# Altium project MOSFET_Four_nodes_network.PrjPcb (part 2 of 2)

## Sheet Sheet5.SchDoc
size A; SheetNumber: 6; SheetTotal: 10
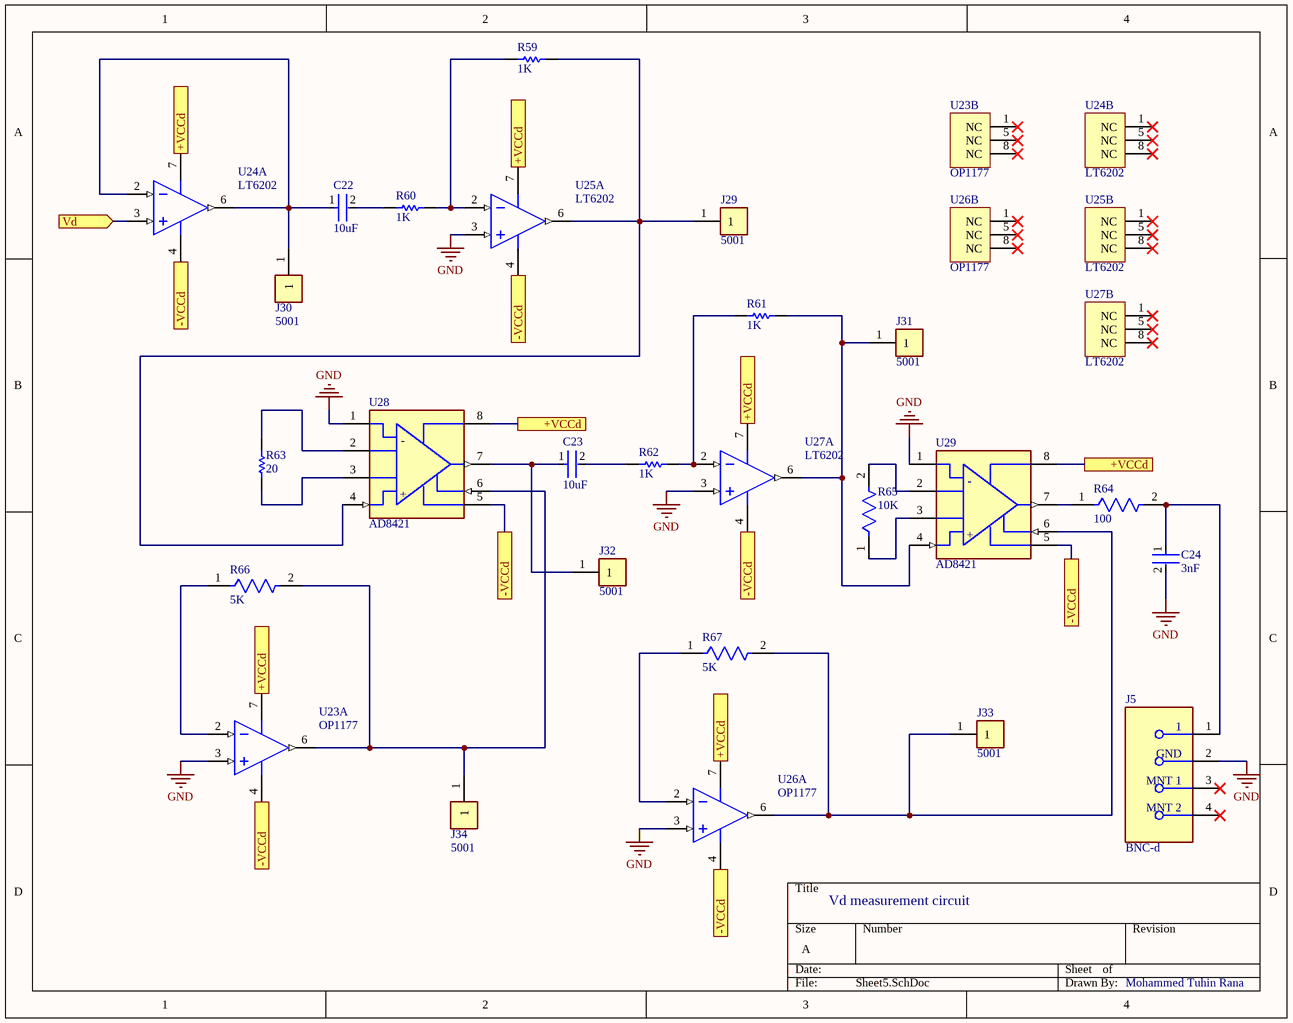
[diagram p5: Sheet5.SchDoc]

### Parts
C22  10uF  [FP-GRM21B-0_1-IPC_C]
C23  10uF  [FP-GRM21B-0_1-IPC_C]
C24  3nF  [FP-C1206C-EB-MFG]
J5  BNC-d  [FP-5413194-2-MFG]
J29  5001  [FP-5001-MFG]
J30  5001  [FP-5001-MFG]
J31  5001  [FP-5001-MFG]
J32  5001  [FP-5001-MFG]
J33  5001  [FP-5001-MFG]
J34  5001  [FP-5001-MFG]
R59  1K  [RESC3216X70X50ML20T25]
R60  1K  [RESC3216X70X50ML20T25]
R61  1K  [RESC3216X70X50ML20T25]
R62  1K  [RESC3216X70X50ML20T25]
R63  20  [RESC3216X60X45ML10T20]
R64  100  [FP-ERA3A-IPC_B]
R65  10K  [FP-ERJPA3-IPC_A]
R66  5K  [FP-RT1206-0_65-MFG]
R67  5K  [FP-RT1206-0_65-MFG]
U23  OP1177  [ADI-R-8_N]  (parts A,B of 2)
U24  LT6202  [LT-S8-8_N]  (parts A,B of 2)
U25  LT6202  [LT-S8-8_N]  (parts A,B of 2)
U26  OP1177  [ADI-R-8_N]  (parts A,B of 2)
U27  LT6202  [LT-S8-8_N]  (parts A,B of 2)
U28  AD8421  [FP-R-8-IPC_C]
U29  AD8421  [FP-R-8-IPC_C]

### Ports
+VCCd (see Sheet5[1A], Sheet5[1C], Sheet5[2A], Sheet5[2B], Sheet5[3B], Sheet5[3C], Sheet10[4B]), +VCCd (see Sheet5[1A], Sheet5[1C], Sheet5[2A], Sheet5[2B], Sheet5[3B], Sheet5[4B], Sheet10[4B]), +VCCd (see Sheet5[1A], Sheet5[1C], Sheet5[2A], Sheet5[2B], Sheet5[3C], Sheet5[4B], Sheet10[4B]), +VCCd (see Sheet5[1A], Sheet5[1C], Sheet5[2A], Sheet5[3B], Sheet5[3C], Sheet5[4B], Sheet10[4B]), +VCCd (see Sheet5[1A], Sheet5[1C], Sheet5[2B], Sheet5[3B], Sheet5[3C], Sheet5[4B], Sheet10[4B]), +VCCd (see Sheet5[1A], Sheet5[2A], Sheet5[2B], Sheet5[3B], Sheet5[3C], Sheet5[4B], Sheet10[4B]), +VCCd (see Sheet5[1C], Sheet5[2A], Sheet5[2B], Sheet5[3B], Sheet5[3C], Sheet5[4B], Sheet10[4B]), -VCCd (see Sheet5[1B], Sheet5[1D], Sheet5[2B], Sheet5[2C], Sheet5[3C], Sheet5[3D], Sheet10[3B]), -VCCd (see Sheet5[1B], Sheet5[1D], Sheet5[2B], Sheet5[2C], Sheet5[3C], Sheet5[4C], Sheet10[3B]), -VCCd (see Sheet5[1B], Sheet5[1D], Sheet5[2B], Sheet5[2C], Sheet5[3D], Sheet5[4C], Sheet10[3B]), -VCCd (see Sheet5[1B], Sheet5[1D], Sheet5[2B], Sheet5[3C], Sheet5[3D], Sheet5[4C], Sheet10[3B]), -VCCd (see Sheet5[1B], Sheet5[1D], Sheet5[2C], Sheet5[3C], Sheet5[3D], Sheet5[4C], Sheet10[3B]), -VCCd (see Sheet5[1B], Sheet5[2B], Sheet5[2C], Sheet5[3C], Sheet5[3D], Sheet5[4C], Sheet10[3B]), -VCCd (see Sheet5[1D], Sheet5[2B], Sheet5[2C], Sheet5[3C], Sheet5[3D], Sheet5[4C], Sheet10[3B]), Vd (in, see Sheet2[4B])

### Nets
GND: C24.2 J5.2(GND) U23.3(+IN) U25.3(+IN) U26.3(+IN) U27.3(+IN) U28.1(-IN) U29.1(-IN)
NetC22_1: C22.1 J30.1 U24.2(-IN) U24.6(OUT)
NetC22_2: C22.2 R60.1
NetC23_1: C23.1 J32.1 U28.7(VOUT)
NetC23_2: C23.2 R62.1
NetC24_1: C24.1 J5.1 R64.2
NetC48_1: U23.7(+V) U24.7(V+) U25.7(V+) U26.7(+V) U27.7(V+) U28.8(+VS) U29.8(+VS) ; port +VCCd
NetC49_1: U23.4(-V) U24.4(V-) U25.4(V-) U26.4(-V) U27.4(V-) U28.5(-VS) U29.5(-VS) ; port -VCCd
NetJ29_1: J29.1 R59.2 U25.6(OUT) U28.4(+IN)
NetJ31_1: J31.1 R61.2 U27.6(OUT) U29.4(+IN)
NetJ33_1: J33.1 R67.2 U26.6(OUT) U29.6(REF)
NetJ34_1: J34.1 R66.2 U23.6(OUT) U28.6(REF)
NetQ5_3: U24.3(+IN) ; port Vd
NetR59_1: R59.1 R60.2 U25.2(-IN)
NetR61_1: R61.1 R62.2 U27.2(-IN)
NetR63_1: R63.1 U28.3(2_RG)
NetR63_2: R63.2 U28.2(1_RG)
NetR64_1: R64.1 U29.7(VOUT)
NetR65_1: R65.1 U29.3(2_RG)
NetR65_2: R65.2 U29.2(1_RG)
NetR66_1: R66.1 U23.2(-IN)
NetR67_1: R67.1 U26.2(-IN)

Not connected (* = marked no-connect by the designer): J5 3(MNT_1)* 4(MNT_2)*; U23 1(NC)* 5(NC)* 8(NC)*; U24 1(NC)* 5(NC)* 8(NC)*; U25 1(NC)* 5(NC)* 8(NC)*; U26 1(NC)* 5(NC)* 8(NC)*; U27 1(NC)* 5(NC)* 8(NC)*

### Notes on the sheet
- Vd measurement circuit
- Mohammed Tuhin Rana
- (in symbol CMP-09116-000012-1) -; +

### Library data of the parts
C22 C23 = CMP-2007-03453-2: Chip Multilayer Ceramic Capacitors for General Purpose, 0805, 10uF, X5R, 15%, 10%, 16V; Radiation Hardening: No; Thickness: 0.053inch; Voltage Rating (DC): 16V; Lead Free: Lead Free; Package Quantity: 1; Width: 1.25mm; Case Code (Imperial): 0805; Depth: 1.25mm; Packaging: Tape and Reel; Dielectric: X5R; Max Operating Temperature: 85°C; Tolerance: 10%; Voltage Rating: 16V; Voltage: 16V; Capacitance: 10uF; Height: 1.25mm; Case Code (Metric): 2012; Material: Ceramic; Mount: Surface Mount; Case/Package: 0805; REACH SVHC: No SVHC; Length: 2mm; Min Operating Temperature: -55°C; Termination: SMD/SMT
C24 = CMP-1037-02920-2: CAP CER 3000PF 50V NP0 1206; Manufacturer Part Number: C1206C302J5GACTU; Manufacturer: KEMET; Value: 3,000 pF; Temperature Coefficient: 15%; Tolerance: 0.05; Material: Ceramic; Automotive Grade: Grade 0; Temperature Characteristic: C0G; ComponentLink2URL: https://content.kemet.com/datasheets/KEM_C1007_X8R_ULTRA_150C_SMD.pdf; Device Class L3: Ceramic Capacitors; Device Class L2: Capacitors; ComponentLink2Description: Datasheet; Automotive: Yes; Temperature Range Low: -55°C; Temperature: -55°C to +150°C; Octopart: https://octopart.com/c1206c302j5gactu-kemet-12776246; Height: 0.88mm; Lead Free: Yes; Device Class L1: Passive Components; Digikey Description: CAP CER 3000PF 50V NP0 1206; Category: Cap; Mouser Description: Capacitor, Ceramic, 3Nf, 50Vdc, 5-% Tol, 5+% Tol, C0g-Tc Code, -30, 30Ppm-Tc Rohs Compliant: Yes; RoHS: TRUE; Ipc Land Pattern Name: CAPC320160X78; Voltage Rating: 50 V; Capacitance: 3,000 pF; Temperature Range High: +150°C; Package: C1206C-EB
J5 = CMP-03790-39547162-1: 5413194-2 RF BNC Connector, 1 Contact(s), Female, Panel Mount, Solder Terminal, Locking, Jack; Manufacturer Lifecycle Status: ACTIVE; Impedance: 75Ω; Number of Positions: 1; Outside Diameter: 14.529mm; Polarity: Normal, Standard; Sealable: No; Dielectric Material: Polymethylpentene; PCB Mounting Orientation: Right Angle; Voltage Rating: 500V; Body Plating: Nickel; Frequency: 2GHz; Tail Length: 4.11mm; Insulation Resistance: 5GΩ; Body Material: Zinc; ELV: Compliant; Lead Free: Lead Free; Radiation Hardening: No; Gender: Female; Color: Black; Mount: Panel, Through Hole; Packaging: Bulk; NexarPartId: 39547162; Housing Color: Black; Fastening Type: Bayonet; Contact Gender: Female; Lifecycle Status: Production; Depth: 34.93mm; Min Operating Temperature: -55°C; Number of Contacts: 1; RoHS: Compliant; Length: 14.76mm; Insulation Material: Polymethylpentene; Termination: Solder, Through Hole; Connector Type: BNC; Contact Plating: Gold; Max Frequency: 2GHz; Max Operating Temperature: 85°C; Height: 13.18mm; REACH SVHC: Unknown; Orientation: Right Angle; Contact Material: Copper
J29-J34 = CMP-2000-05181-2: PC TEST POINT MINIATURE BLACK; Body Material: Bronze; Plating: Silver; Inside Diameter: 1.27mm; Hole Diameter: 1.6mm; Number of Ports: 1; Outside Diameter: 2.54mm; Insulation: Insulated; Insulation Material: Nylon; Mount: Through Hole; RoHS Compliant: Yes; Series: THM; Height: 0.3inch; Termination: Through Hole; Material: Nylon; Packaging: Bulk; Contact Material: Bronze; REACH SVHC: No SVHC; Contact Plating: Silver; Orientation: Straight; Lead Free: Lead Free; Package Quantity: 100; Length: 7.62mm; Flammability Rating: UL94 V-0; Number of Contacts: 1; Diameter: 2.54mm; Housing Color: Black; Color: Black
R59-R62 = CMP-2003-04406-1: Part Number: ERA8AEB102V; Manufacturer: Panasonic
R63 = CMP-2003-01944-1: Manufacturer: Vishay Dale; Part Number: CRCW120620R0FKEA
R64 = CMP-2000-00870-2: RES SMD 100 OHM 0.1% 1/10W 0603; Voltage Rating: 75V; Power Rating: 100mW; Resistance: 100R; Temperature Coefficient: 25ppm/°C; Number of Terminations: 2; Case/Package: 0603; Termination: SMD/SMT; Number of Pins: 2; Size Code: 0603; Length: 1.6mm; Min Operating Temperature: -55°C; Resistor Type: Thin Film; Depth: 0.8mm; Military Standard: Not; Packaging: Tape and Reel; RoHS Compliant: Yes; Construction: Rectangular; Resistance Tolerance: 0.1%; Contact Plating: Tin; Width: 0.8mm; Mount: Surface Mount; Case Code (Metric): 1608; Max Operating Temperature: 155°C; Height: 0.45mm; Case Code (Imperial): 0603; Series: ERA-3A; Package Quantity: 5000; REACH SVHC: No SVHC; Tolerance: 0.1%; Max Power Dissipation: 100mW; Radiation Hardening: No; Technology: METAL FILM
R65 = CMP-05422-000155-1: RES SMD 10K OHM 1% 1/3W 0603; RoHS Compliant: Yes
R66 R67 = CMP-03412-001731-1: RES SMD 5K OHM 0.1% 1/4W 1206; Manufacturer: Yageo; Manufacturer Part Number: RT1206BRD075KL; Resistance: 5kΩ; Value: 5kΩ; Power Rating: 0.25W; Voltage Rating: 200V; Temperature Coefficient: 25ppm/°C; Series: RT; Mouser Description: Thin Film Resistors - SMD 1/4W 5K ohm .1% 25ppm; Temperature: -55°C to +155°C; Composition: Thin Film; Footprint Url: https://www.yageo.com/upload/website/yageo_PYu-R_Mount_10_19050818_343.pdf; Device Class L1: Passive Components; Temperature Range High: +155°C; Octopart: https://octopart.com/rt1206brd075kl-yageo-29806230; Ipc Land Pattern Name: RESC310160X55; Device Class L3: Chip SMD Resistors; Temperature Range Low: -55°C; Height: 0.65mm; ComponentLink2URL: https://www.yageo.com/upload/media/product/productsearch/datasheet/rchip/PYu-RT_1-to-0.01_RoHS_L_11.pdf; Automotive: No; Category: Res; ComponentLink2Description: Datasheet; Package: RT1206-0.65; Lead Free: Yes; Digikey Description: RES SMD 5K OHM 0.1% 1/4W 1206; Device Class L2: Resistors; RoHS: TRUE; Tolerance: 0.1%
U23 U26 = CMP-0384-00640-2: Single Channel Wide Bandwidth Operational Amplifier, 1.3 MHz BW, 700 mV/us SR, Industrial, 8-pin SOIC (R-8), Reel; PartNumber: OP1177ARZ-REEL7; Manufacturer: Analog Devices; Iq/Amp: 500uA; V Span Max: 36V; Input Bias Current: 500pA; Amplifiers Per Package: 1; Small Signal Bandwidth: 1.3MHz; V Span Min: 5V; Input Offset Voltage: 15uV; ComponentLink2Description: Datasheet; ComponentLink4URL: http://www.analog.com/en/all-operational-amplifiers-op-amps/operational-amplifiers-op-amps/op1177/products/product.html#product-recommendations; ComponentLink3Description: Package Specification; PackageDescription: 8-Pin Standard Small Outline Package, Body 3.9 x 4.9 mm, Pitch 1.27 mm; ComponentLink1URL: http://www.analog.com/en/index.html; PackageReference: R-8; PackageVersion: 060506-A; DatasheetVersion: Rev. G; ComponentLink4Description: Reference Circuit; ComponentLink1Description: Manufacturer URL; Mounting Technology: Surface Mount; RevisionNote: Reference Circuit URL fixed; ComponentLink3URL: http://www.analog.com/static/imported-files/packages/PKG_PDF/SOIC_Narrow%20(R)/R_8.pdf; Code_JEDEC: MS-012-AA; Slew Rate: 700mV/us; ComponentLink2URL: http://www.analog.com/static/imported-files/data_sheets/OP1177_2177_4177.pdf; Generic Part Number: OP1177
U24 U25 U27 = CMP-0359-02644-2: Single Channel, Low Noise, High Speed Operational Amplifier, RRIO, 100 MHz Typical GBW, 25 V/us Typical SR, 2.5 to 12.6 V, 8-Pin SOIC (S8-8), Commercial, Pb-Free; Manufacturer: Linear Technology; PartNumber: LT6202CS8#PBF; Channels (#): 1; Vs Min (V): 2.5; Is (mA) Typical: 2.8; Vos (mV) Typical: 0.1; Vos (mV) Guaranteed: 0.5; GBW (MHz) Typical: 100; Vs Max (V): 12.6; SR (V/us) Typical: 25; RevisionNote: URLs updated; ComponentLink2URL: http://cds.linear.com/docs/en/datasheet/620234fd.pdf; PackageDescription: 8-Pin Plastic Small Outline, Body 4.9 x 3.9 mm, Pitch 1.27 mm; Linear Technology Part Number: LT6202; RoHS: Pb-Free; ComponentLink3Description: Package Specification; ComponentLink2Description: Datasheet; PackageVersion: Rev G; ComponentLink3URL: http://cds.linear.com/docs/en/packaging/05081610_G_SO8.pdf; ComponentLink1Description: Manufacturer URL; DatasheetVersion: Rev. D; PackageReference: LT-S8-8; Mounting Technology: Surface Mount; ComponentLink1URL: http://www.linear.com/; Type: VFB
U28 U29 = CMP-09116-000012-1: IC OPAMP INSTR 10MHZ 8SOIC; Manufacturer: Analog Devices; Manufacturer Part Number: AD8421ARZ-R7; Number Of Channels: 1; Min Supply Voltage: 5V; Max Dual Supply Voltage: 18V; Input Offset Voltage: 0.07mV; Standoff Height: 0.1mm; Min Dual Supply Voltage: 2.5V; Nominal Supply Current: 2mA; Max Supply Voltage: 36V; Input Bias Current: 0.001uA; Max Junction Temp: +150°C; Lead Free: Yes; Temperature: -40°C to +85°C; Device Class L1: Integrated Circuits (ICs); Temperature Range Low: -40°C; Automotive: No; RoHS: TRUE; Bandwidth: 10MHz; Package: R-8; Temperature Range High: +85°C; Octopart: https://octopart.com/ad8421arz-r7-analog+devices-21054779; Digikey Description: IC OPAMP INSTR 10MHZ 8SOIC; Device Class L2: Linear ICs; ComponentLink2Description: Datasheet; Category: IC; ComponentLink2URL: https://www.analog.com/media/en/technical-documentation/data-sheets/AD8421.pdf; Height: 1.75mm; Mouser Description: Instrumentation Amplifiers 3nV/Hz Low Power; Device Class L3: Instrumentation

## Sheet Sheet7.SchDoc
size A; SheetNumber: 7; SheetTotal: 10
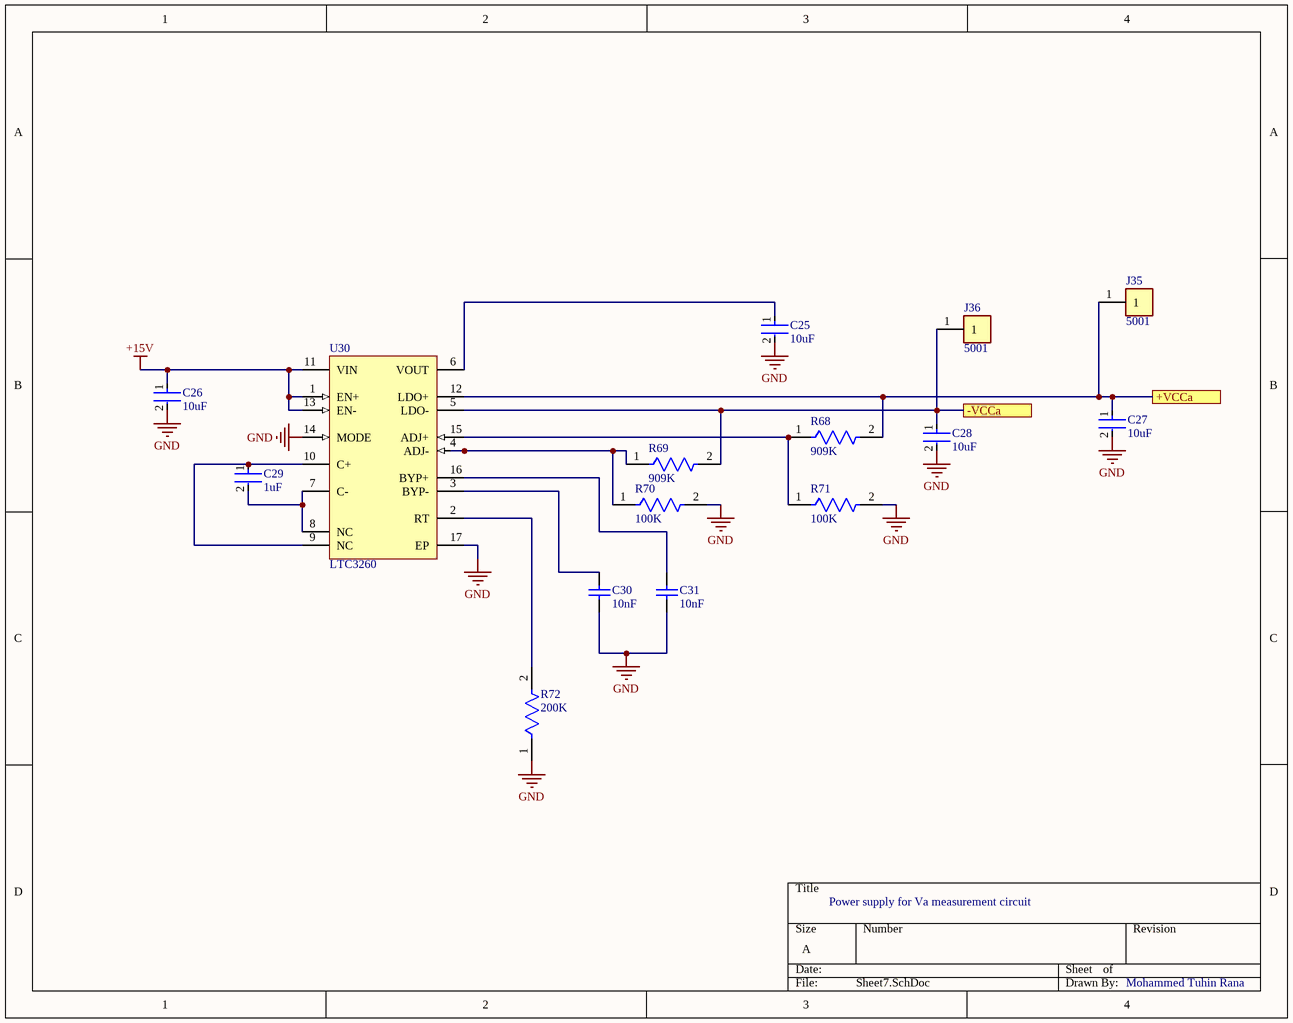
[diagram p6: Sheet7.SchDoc]

### Parts
C25  10uF  [FP-C1210C106M6PACTU-MFG]
C26  10uF  [FP-C1210C106M6PACTU-MFG]
C27  10uF  [FP-C1210C106M6PACTU-MFG]
C28  10uF  [FP-C1210C106M6PACTU-MFG]
C29  1uF  [FP-GRM55D-0_4-IPC_A]
C30  10nF  [CAPC2013X100X50NL20T25]
C31  10nF  [CAPC2013X100X50NL20T25]
J35  5001  [FP-5001-MFG]
J36  5001  [FP-5001-MFG]
R68  909K  [FP-CRCW1206-e3-IPC_C]
R69  909K  [FP-CRCW1206-e3-IPC_C]
R70  100K  [FP-AC1206-MFG]
R71  100K  [FP-AC1206-MFG]
R72  200K  [FP-CRCW1206-e3-MFG]
U30  LTC3260  [LT-MSE-16-EDP_L]

### Ports
+VCCa (see Sheet3[1A], Sheet3[1C], Sheet3[2A], Sheet3[2B], Sheet3[3B], Sheet3[3C], Sheet3[4B]), -VCCa (see Sheet3[1B], Sheet3[1D], Sheet3[2B], Sheet3[2C], Sheet3[3C], Sheet3[3D], Sheet3[4C])

### Nets
+15V: C26.1 U30.1(EN+) U30.11(VIN) U30.13(EN-)
GND: C25.2 C26.2 C27.2 C28.2 C30.1 C31.1 R70.2 R71.2 R72.1 U30.14(MODE) U30.17(EP)
NetC25_1: C25.1 U30.6(VOUT)
NetC27_1: C27.1 J35.1 R68.2 U30.12(LDO+) ; port +VCCa
NetC28_1: C28.1 J36.1 R69.2 U30.5(LDO-) ; port -VCCa
NetC29_1: C29.1 U30.9(NC) U30.10(C+)
NetC29_2: C29.2 U30.7(C-) U30.8(NC)
NetC30_2: C30.2 U30.3(BYP-)
NetC31_2: C31.2 U30.16(BYP+)
NetR68_1: R68.1 R71.1 U30.15(ADJ+)
NetR69_1: R69.1 R70.1 U30.4(ADJ-)
NetR72_2: R72.2 U30.2(RT)

### Notes on the sheet
- Power supply for Va measurement circuit
- Mohammed Tuhin Rana

### Library data of the parts
C25-C28 = CMP-1038-02235-2: CAP CER 10UF 35V X5R 1210; Dissipation Factor: 2.5%; Tolerance: 20%; Dielectric Material: Ceramic; Voltage: 35V; Package Quantity: 2000; Series: C; Case Code (Metric): 3225; Length: 3.2mm; Dielectric: X5R; Height: 1.9mm; Max Operating Temperature: 85°C; Termination: SMD/SMT; Case/Package: 1210; Min Operating Temperature: -55°C; Depth: 2.5mm; Packaging: Tape and Reel; Case Code (Imperial): 1210; Width: 2.5mm; Radiation Hardening: No; Voltage Rating: 35V; Mount: Surface Mount; Voltage Rating (DC): 35V; Capacitance: 10uF; Thickness: 0.083inch; Construction: Flat; REACH SVHC: No SVHC
C29 = CMP-2000-06370-2: Chip Multilayer Ceramic Capacitors for General Purpose, 2220, 1.0uF, X7R, 15%, 10%, 250V; Width: 5mm; Capacitance: 1uF; Height: 2mm; Case Code (Imperial): 2220; Voltage Rating (DC): 250V; Max Operating Temperature: 125°C; Number of Pins: 2; Min Operating Temperature: -55°C; Termination: SMD/SMT; Case/Package: 2220; Dielectric: X7R; Material: Ceramic; REACH SVHC: No SVHC; Voltage: 250V; Packaging: Tape and Reel; Thickness: 0.087inch; Depth: 5mm; Package Quantity: 1; Tolerance: 10%; Mount: Surface Mount; Voltage Rating: 250V; Length: 5.7mm; Case Code (Metric): 5750; Lead Free: Lead Free
C30 C31 = CMP-2007-03708-1: Part Number: C0805F103K5RACTU; Manufacturer: Kemet
J35 J36 = CMP-2000-05181-2: as J29 on sheet Sheet5; Insulation Material: Nylon; Mount: Through Hole; RoHS Compliant: Yes; Series: THM; Height: 0.3inch; Termination: Through Hole; Material: Nylon; Packaging: Bulk; Contact Material: Bronze; REACH SVHC: No SVHC; Contact Plating: Silver; Orientation: Straight; Lead Free: Lead Free; Package Quantity: 100; Length: 7.62mm; Flammability Rating: UL94 V-0; Number of Contacts: 1; Diameter: 2.54mm; Housing Color: Black; Color: Black
R68 R69 = CMP-2003-02425-2: RES Thick Film, 909kΩ, 1%, 0.25W, 100ppm/°C, 1206; Resistance: 909kR; Power Rating: 250mW; Voltage Rating: 200V; Contact Plating: Tin; Number of Terminations: 2; Package Quantity: 10; Case Code (Imperial): 1206; Features: Automotive AEC-Q200; Termination: SMD/SMT; Lead Free: Lead Free; Depth: 1.6mm; Min Operating Temperature: -55°C; Case/Package: 1206; Width: 1.6mm; Tolerance: 1%; Military Standard: Not; Voltage Rating (DC): 200V; Composition: Thick Film; Radiation Hardening: No; Max Power Dissipation: 250mW; Packaging: Tape and Reel; Case Code (Metric): 3216; Height: 0.024inch; Temperature Coefficient: 100ppm/°C; Max Operating Temperature: 155°C; Length: 3.2mm; Weight: 0.000353oz
R70 R71 = CMP-2003-04909-2: RES SMD 100K OHM 1% 1/4W 1206; Manufacturer: Yageo; Manufacturer Part Number: AC1206FR-07100KL; Resistance: 100KΩ; Power Rating: 0.25W; Value: 100KΩ; Voltage Rating: 200V; Automotive Grade: Grade 0; Tolerance: 0.01; Mouser Description: RES SMD 100K OHM 1% 1/4W 1206; Ipc Land Pattern Name: RESC310160X55; Temperature Range Low: -55°C; Package: AC1206; Temperature: -55°C to +155°C; Device Class L3: Chip SMD Resistors; Lead Free: Yes; Temperature Range High: +155°C; Series: AC; Octopart: https://octopart.com/ac1206fr-07100kl-yageo-21711116; Height: 0.65mm; Footprint Url: http://www.yageo.com/exep/pages/download/literatures/PYu-R_Mount_10.pdf; RoHS: TRUE; Category: Res; Automotive: Yes; Composition: Thick Film; Device Class L2: Resistors; ComponentLink2URL: http://www.yageo.com/NewPortal/yageodocoutput?fileName=/pdf/R-Chip/PYu-AC_51_RoHS_L_6.pdf; Digikey Description: RES SMD 100K OHM 1% 1/4W 1206; ComponentLink2Description: Datasheet; Device Class L1: Passive Components
R72 = CMP-2003-01933-2: RES Thick Film, 200kΩ, 1%, 0.25W, 100ppm/°C, 1206; Power Rating: 250mW; Resistance: 200kR; Working Voltage: 200V; Case Code (Metric): 3216; Tolerance: 1%; Mount: Surface Mount; Packaging: Tape and Reel; Case Code (Imperial): 1206; Depth: 1.6mm; Military Standard: Not; Max Operating Temperature: 155°C; Length: 3.2mm; Radiation Hardening: No; Number of Terminations: 2; Features: Automotive AEC-Q200; Width: 1.6mm; Lead Free: Lead Free; Composition: Thick Film; Package Quantity: 10; Min Operating Temperature: -55°C; Contact Plating: Tin; Voltage Rating (DC): 200V; Temperature Coefficient: 100ppm/°C; Height: 0.55mm; Weight: 0.000353oz; Case/Package: 1206; Voltage Rating: 200V; Termination: SMD/SMT; Max Power Dissipation: 250mW
U30 = CMP-0475-00260-1: Low Noise Dual Supply Inverting Charge Pump, 4.5 to 32 V Vin, Adjustable Vout, 16-pin SOP (MSE-16-EDP), -40 to 125 degC, Pb-Free, Tape and Reel; PartNumber: LTC3260EMSE#TRPBF; Manufacturer: Linear Technology; Max Iout(mA): 100; Isupply(mA): 0.1; Ishutdown(uA): 2; Vin Min(V): 4.5; Frequency(kHz): 500; Vin Max(V): 32; Voutput: Adj; ComponentLink2URL: http://cds.linear.com/docs/en/datasheet/3260fa.pdf; PackageReference: MSE-16; Mounting Technology: Surface Mount; DatasheetVersion: Rev. A; ComponentLink3URL: http://cds.linear.com/docs/en/packaging/05081667_F_MSE16.pdf; ComponentLink1Description: Manufacturer URL; ComponentLink1URL: http://www.linear.com/; Packing: Tape and Reel; RoHS: TRUE; PackageDescription: 16-Pin Plastic MSOP, Exposed Die Pad, Body 4.039 x 3 mm, Pitch 0.5 mm; ComponentLink3Description: Package Specification; ComponentLink2Description: Datasheet; PackageVersion: Rev. F, 05/2013

## Sheet Sheet8.SchDoc
size A; SheetNumber: 8; SheetTotal: 10
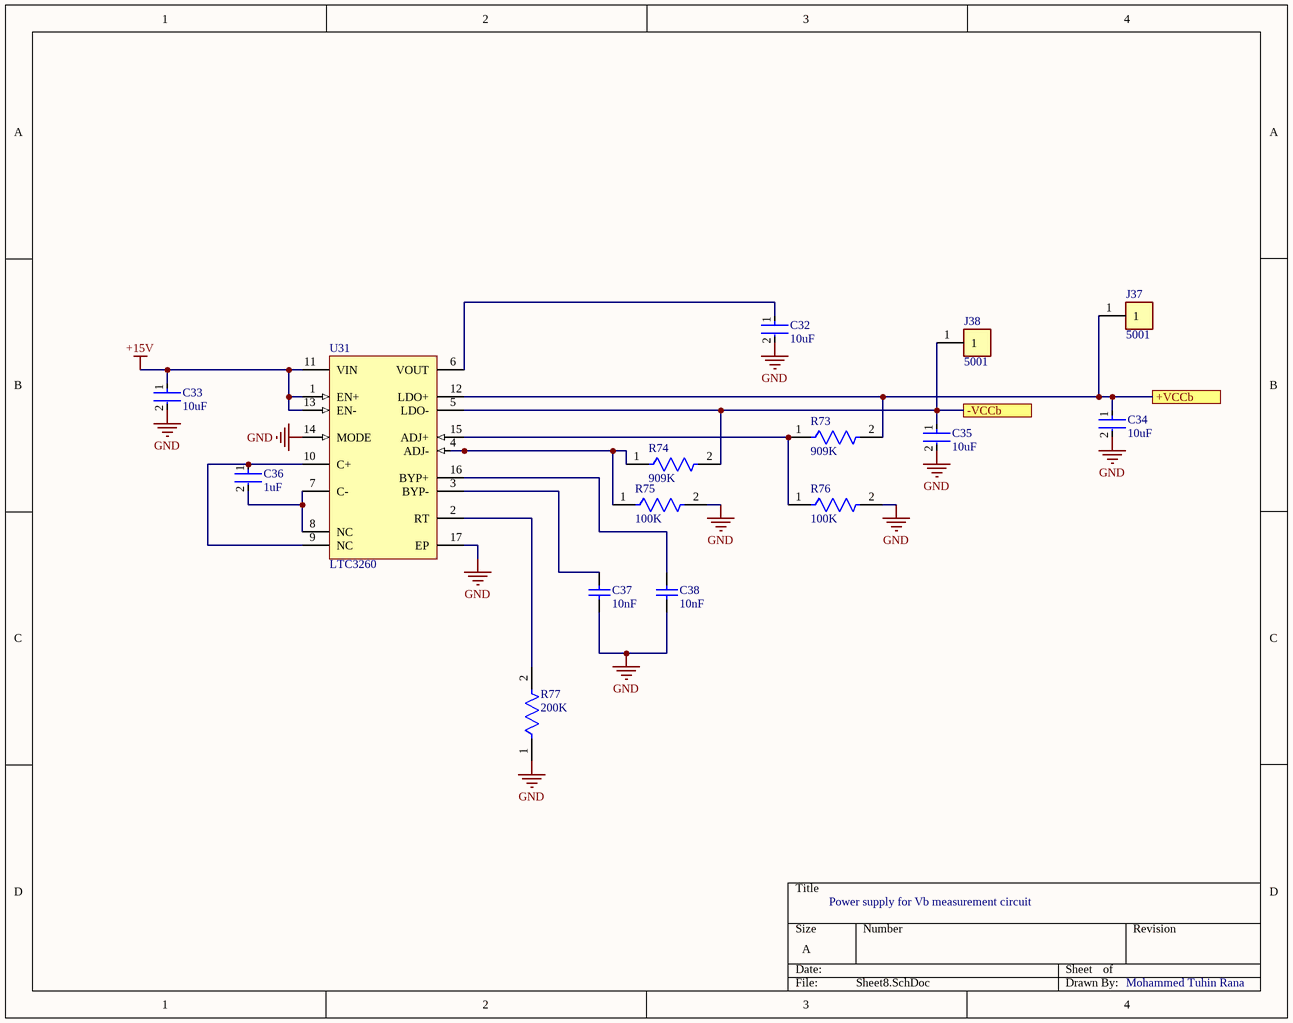
[diagram p7: Sheet8.SchDoc]

### Parts
C32  10uF  [FP-C1210C106M6PACTU-MFG]
C33  10uF  [FP-C1210C106M6PACTU-MFG]
C34  10uF  [FP-C1210C106M6PACTU-MFG]
C35  10uF  [FP-C1210C106M6PACTU-MFG]
C36  1uF  [FP-GRM55D-0_4-IPC_A]
C37  10nF  [CAPC2013X100X50NL20T25]
C38  10nF  [CAPC2013X100X50NL20T25]
J37  5001  [FP-5001-MFG]
J38  5001  [FP-5001-MFG]
R73  909K  [FP-CRCW1206-e3-IPC_C]
R74  909K  [FP-CRCW1206-e3-IPC_C]
R75  100K  [FP-AC1206-MFG]
R76  100K  [FP-AC1206-MFG]
R77  200K  [FP-CRCW1206-e3-MFG]
U31  LTC3260  [LT-MSE-16-EDP_L]

### Ports
+VCCb (see Sheet4[1A], Sheet4[1C], Sheet4[2A], Sheet4[2B], Sheet4[3B], Sheet4[3C], Sheet4[4B]), -VCCb (see Sheet4[1B], Sheet4[1D], Sheet4[2B], Sheet4[2C], Sheet4[3C], Sheet4[3D], Sheet4[4C])

### Nets
+15V: C33.1 U31.1(EN+) U31.11(VIN) U31.13(EN-)
GND: C32.2 C33.2 C34.2 C35.2 C37.1 C38.1 R75.2 R76.2 R77.1 U31.14(MODE) U31.17(EP)
NetC32_1: C32.1 U31.6(VOUT)
NetC34_1: C34.1 J37.1 R73.2 U31.12(LDO+) ; port +VCCb
NetC35_1: C35.1 J38.1 R74.2 U31.5(LDO-) ; port -VCCb
NetC36_1: C36.1 U31.9(NC) U31.10(C+)
NetC36_2: C36.2 U31.7(C-) U31.8(NC)
NetC37_2: C37.2 U31.3(BYP-)
NetC38_2: C38.2 U31.16(BYP+)
NetR73_1: R73.1 R76.1 U31.15(ADJ+)
NetR74_1: R74.1 R75.1 U31.4(ADJ-)
NetR77_2: R77.2 U31.2(RT)

### Notes on the sheet
- Power supply for Vb measurement circuit
- Mohammed Tuhin Rana

### Library data of the parts
C32-C35 = CMP-1038-02235-2: as C25 on sheet Sheet7; Voltage: 35V; Package Quantity: 2000; Series: C; Case Code (Metric): 3225; Length: 3.2mm; Dielectric: X5R; Height: 1.9mm; Max Operating Temperature: 85°C; Termination: SMD/SMT; Case/Package: 1210; Min Operating Temperature: -55°C; Depth: 2.5mm; Packaging: Tape and Reel; Case Code (Imperial): 1210; Width: 2.5mm; Radiation Hardening: No; Voltage Rating: 35V; Mount: Surface Mount; Voltage Rating (DC): 35V; Capacitance: 10uF; Thickness: 0.083inch; Construction: Flat; REACH SVHC: No SVHC
C36 = CMP-2000-06370-2: as C29 on sheet Sheet7; Width: 5mm; Capacitance: 1uF; Height: 2mm; Case Code (Imperial): 2220; Voltage Rating (DC): 250V; Max Operating Temperature: 125°C; Number of Pins: 2; Min Operating Temperature: -55°C; Termination: SMD/SMT; Case/Package: 2220; Dielectric: X7R; Material: Ceramic; REACH SVHC: No SVHC; Voltage: 250V; Packaging: Tape and Reel; Thickness: 0.087inch; Depth: 5mm; Package Quantity: 1; Tolerance: 10%; Mount: Surface Mount; Voltage Rating: 250V; Length: 5.7mm; Case Code (Metric): 5750; Lead Free: Lead Free
C37 C38 = CMP-2007-03708-1: as C30 on sheet Sheet7
J37 J38 = CMP-2000-05181-2: as J29 on sheet Sheet5; Insulation Material: Nylon; Mount: Through Hole; RoHS Compliant: Yes; Series: THM; Height: 0.3inch; Termination: Through Hole; Material: Nylon; Packaging: Bulk; Contact Material: Bronze; REACH SVHC: No SVHC; Contact Plating: Silver; Orientation: Straight; Lead Free: Lead Free; Package Quantity: 100; Length: 7.62mm; Flammability Rating: UL94 V-0; Number of Contacts: 1; Diameter: 2.54mm; Housing Color: Black; Color: Black
R73 R74 = CMP-2003-02425-2: as R68 on sheet Sheet7; Contact Plating: Tin; Number of Terminations: 2; Package Quantity: 10; Case Code (Imperial): 1206; Features: Automotive AEC-Q200; Termination: SMD/SMT; Lead Free: Lead Free; Depth: 1.6mm; Min Operating Temperature: -55°C; Case/Package: 1206; Width: 1.6mm; Tolerance: 1%; Military Standard: Not; Voltage Rating (DC): 200V; Composition: Thick Film; Radiation Hardening: No; Max Power Dissipation: 250mW; Packaging: Tape and Reel; Case Code (Metric): 3216; Height: 0.024inch; Temperature Coefficient: 100ppm/°C; Max Operating Temperature: 155°C; Length: 3.2mm; Weight: 0.000353oz
R75 R76 = CMP-2003-04909-2: as R70 on sheet Sheet7; Mouser Description: RES SMD 100K OHM 1% 1/4W 1206; Ipc Land Pattern Name: RESC310160X55; Temperature Range Low: -55°C; Package: AC1206; Temperature: -55°C to +155°C; Device Class L3: Chip SMD Resistors; Lead Free: Yes; Temperature Range High: +155°C; Series: AC; Octopart: https://octopart.com/ac1206fr-07100kl-yageo-21711116; Height: 0.65mm; Footprint Url: http://www.yageo.com/exep/pages/download/literatures/PYu-R_Mount_10.pdf; RoHS: TRUE; Category: Res; Automotive: Yes; Composition: Thick Film; Device Class L2: Resistors; ComponentLink2URL: http://www.yageo.com/NewPortal/yageodocoutput?fileName=/pdf/R-Chip/PYu-AC_51_RoHS_L_6.pdf; Digikey Description: RES SMD 100K OHM 1% 1/4W 1206; ComponentLink2Description: Datasheet; Device Class L1: Passive Components
R77 = CMP-2003-01933-2: as R72 on sheet Sheet7; Case Code (Metric): 3216; Tolerance: 1%; Mount: Surface Mount; Packaging: Tape and Reel; Case Code (Imperial): 1206; Depth: 1.6mm; Military Standard: Not; Max Operating Temperature: 155°C; Length: 3.2mm; Radiation Hardening: No; Number of Terminations: 2; Features: Automotive AEC-Q200; Width: 1.6mm; Lead Free: Lead Free; Composition: Thick Film; Package Quantity: 10; Min Operating Temperature: -55°C; Contact Plating: Tin; Voltage Rating (DC): 200V; Temperature Coefficient: 100ppm/°C; Height: 0.55mm; Weight: 0.000353oz; Case/Package: 1206; Voltage Rating: 200V; Termination: SMD/SMT; Max Power Dissipation: 250mW
U31 = CMP-0475-00260-1: as U30 on sheet Sheet7; ComponentLink2URL: http://cds.linear.com/docs/en/datasheet/3260fa.pdf; PackageReference: MSE-16; Mounting Technology: Surface Mount; DatasheetVersion: Rev. A; ComponentLink3URL: http://cds.linear.com/docs/en/packaging/05081667_F_MSE16.pdf; ComponentLink1Description: Manufacturer URL; ComponentLink1URL: http://www.linear.com/; Packing: Tape and Reel; RoHS: TRUE; PackageDescription: 16-Pin Plastic MSOP, Exposed Die Pad, Body 4.039 x 3 mm, Pitch 0.5 mm; ComponentLink3Description: Package Specification; ComponentLink2Description: Datasheet; PackageVersion: Rev. F, 05/2013

## Sheet Sheet9.SchDoc
size A; SheetNumber: 9; SheetTotal: 10
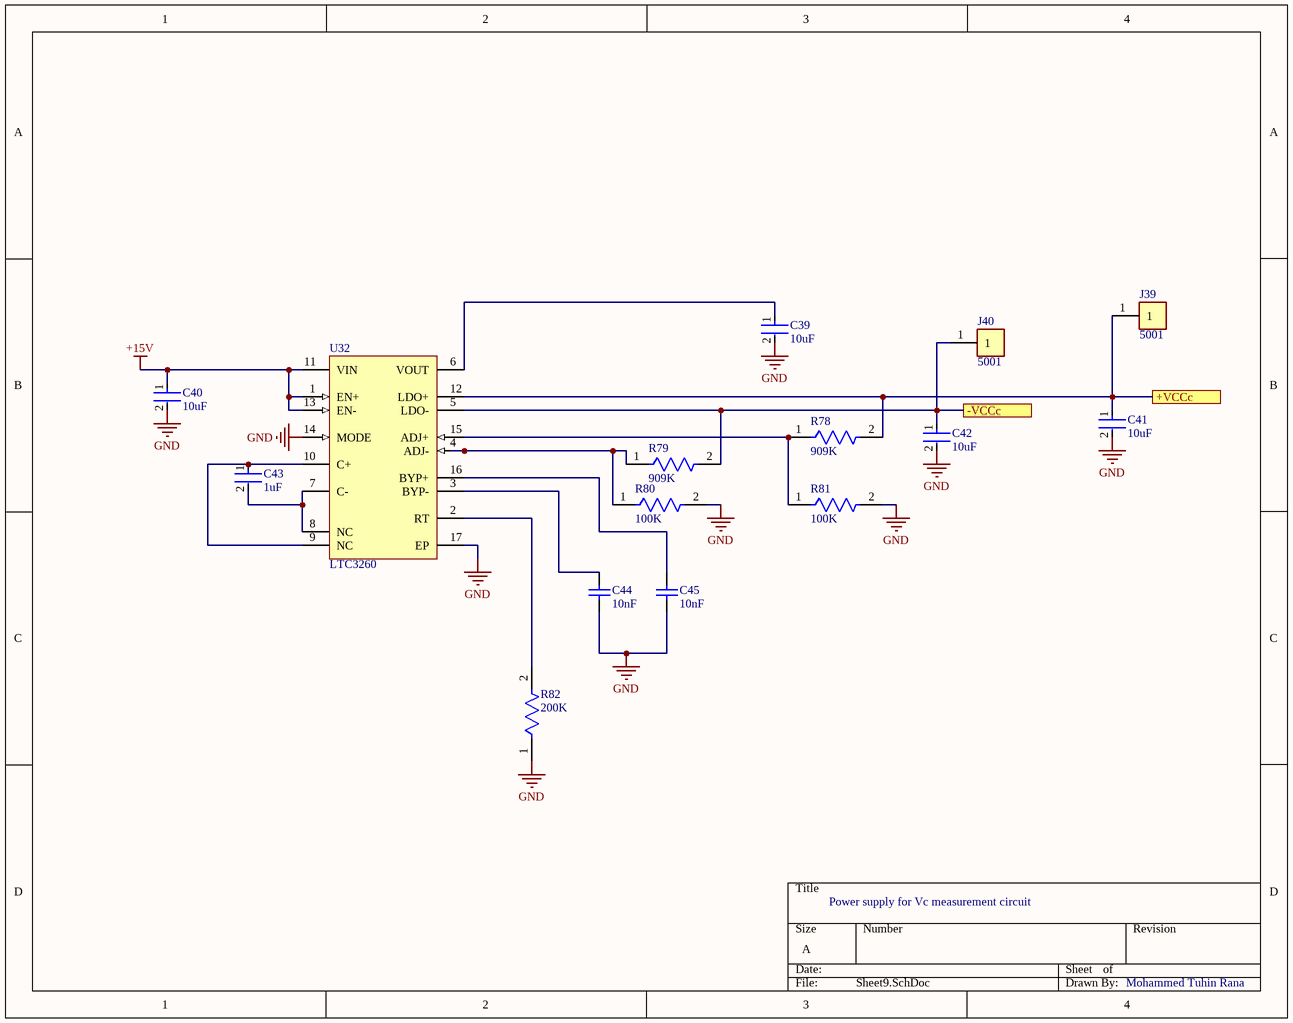
[diagram p8: Sheet9.SchDoc]

### Parts
C39  10uF  [FP-C1210C106M6PACTU-MFG]
C40  10uF  [FP-C1210C106M6PACTU-MFG]
C41  10uF  [FP-C1210C106M6PACTU-MFG]
C42  10uF  [FP-C1210C106M6PACTU-MFG]
C43  1uF  [FP-GRM55D-0_4-IPC_A]
C44  10nF  [CAPC2013X100X50NL20T25]
C45  10nF  [CAPC2013X100X50NL20T25]
J39  5001  [FP-5001-MFG]
J40  5001  [FP-5001-MFG]
R78  909K  [FP-CRCW1206-e3-IPC_C]
R79  909K  [FP-CRCW1206-e3-IPC_C]
R80  100K  [FP-AC1206-MFG]
R81  100K  [FP-AC1206-MFG]
R82  200K  [FP-CRCW1206-e3-MFG]
U32  LTC3260  [LT-MSE-16-EDP_L]

### Ports
+VCCc (see Sheet6[1A], Sheet6[1C], Sheet6[2A], Sheet6[2B], Sheet6[3B], Sheet6[3C], Sheet6[4B]), -VCCc (see Sheet6[1B], Sheet6[1D], Sheet6[2B], Sheet6[2C], Sheet6[3C], Sheet6[3D], Sheet6[4C])

### Nets
+15V: C40.1 U32.1(EN+) U32.11(VIN) U32.13(EN-)
GND: C39.2 C40.2 C41.2 C42.2 C44.1 C45.1 R80.2 R81.2 R82.1 U32.14(MODE) U32.17(EP)
NetC39_1: C39.1 U32.6(VOUT)
NetC41_1: C41.1 J39.1 R78.2 U32.12(LDO+) ; port +VCCc
NetC42_1: C42.1 J40.1 R79.2 U32.5(LDO-) ; port -VCCc
NetC43_1: C43.1 U32.9(NC) U32.10(C+)
NetC43_2: C43.2 U32.7(C-) U32.8(NC)
NetC44_2: C44.2 U32.3(BYP-)
NetC45_2: C45.2 U32.16(BYP+)
NetR78_1: R78.1 R81.1 U32.15(ADJ+)
NetR79_1: R79.1 R80.1 U32.4(ADJ-)
NetR82_2: R82.2 U32.2(RT)

### Notes on the sheet
- Power supply for Vc measurement circuit
- Mohammed Tuhin Rana

### Library data of the parts
C39-C42 = CMP-1038-02235-2: as C25 on sheet Sheet7; Voltage: 35V; Package Quantity: 2000; Series: C; Case Code (Metric): 3225; Length: 3.2mm; Dielectric: X5R; Height: 1.9mm; Max Operating Temperature: 85°C; Termination: SMD/SMT; Case/Package: 1210; Min Operating Temperature: -55°C; Depth: 2.5mm; Packaging: Tape and Reel; Case Code (Imperial): 1210; Width: 2.5mm; Radiation Hardening: No; Voltage Rating: 35V; Mount: Surface Mount; Voltage Rating (DC): 35V; Capacitance: 10uF; Thickness: 0.083inch; Construction: Flat; REACH SVHC: No SVHC
C43 = CMP-2000-06370-2: as C29 on sheet Sheet7; Width: 5mm; Capacitance: 1uF; Height: 2mm; Case Code (Imperial): 2220; Voltage Rating (DC): 250V; Max Operating Temperature: 125°C; Number of Pins: 2; Min Operating Temperature: -55°C; Termination: SMD/SMT; Case/Package: 2220; Dielectric: X7R; Material: Ceramic; REACH SVHC: No SVHC; Voltage: 250V; Packaging: Tape and Reel; Thickness: 0.087inch; Depth: 5mm; Package Quantity: 1; Tolerance: 10%; Mount: Surface Mount; Voltage Rating: 250V; Length: 5.7mm; Case Code (Metric): 5750; Lead Free: Lead Free
C44 C45 = CMP-2007-03708-1: as C30 on sheet Sheet7
J39 J40 = CMP-2000-05181-2: as J29 on sheet Sheet5; Insulation Material: Nylon; Mount: Through Hole; RoHS Compliant: Yes; Series: THM; Height: 0.3inch; Termination: Through Hole; Material: Nylon; Packaging: Bulk; Contact Material: Bronze; REACH SVHC: No SVHC; Contact Plating: Silver; Orientation: Straight; Lead Free: Lead Free; Package Quantity: 100; Length: 7.62mm; Flammability Rating: UL94 V-0; Number of Contacts: 1; Diameter: 2.54mm; Housing Color: Black; Color: Black
R78 R79 = CMP-2003-02425-2: as R68 on sheet Sheet7; Contact Plating: Tin; Number of Terminations: 2; Package Quantity: 10; Case Code (Imperial): 1206; Features: Automotive AEC-Q200; Termination: SMD/SMT; Lead Free: Lead Free; Depth: 1.6mm; Min Operating Temperature: -55°C; Case/Package: 1206; Width: 1.6mm; Tolerance: 1%; Military Standard: Not; Voltage Rating (DC): 200V; Composition: Thick Film; Radiation Hardening: No; Max Power Dissipation: 250mW; Packaging: Tape and Reel; Case Code (Metric): 3216; Height: 0.024inch; Temperature Coefficient: 100ppm/°C; Max Operating Temperature: 155°C; Length: 3.2mm; Weight: 0.000353oz
R80 R81 = CMP-2003-04909-2: as R70 on sheet Sheet7; Mouser Description: RES SMD 100K OHM 1% 1/4W 1206; Ipc Land Pattern Name: RESC310160X55; Temperature Range Low: -55°C; Package: AC1206; Temperature: -55°C to +155°C; Device Class L3: Chip SMD Resistors; Lead Free: Yes; Temperature Range High: +155°C; Series: AC; Octopart: https://octopart.com/ac1206fr-07100kl-yageo-21711116; Height: 0.65mm; Footprint Url: http://www.yageo.com/exep/pages/download/literatures/PYu-R_Mount_10.pdf; RoHS: TRUE; Category: Res; Automotive: Yes; Composition: Thick Film; Device Class L2: Resistors; ComponentLink2URL: http://www.yageo.com/NewPortal/yageodocoutput?fileName=/pdf/R-Chip/PYu-AC_51_RoHS_L_6.pdf; Digikey Description: RES SMD 100K OHM 1% 1/4W 1206; ComponentLink2Description: Datasheet; Device Class L1: Passive Components
R82 = CMP-2003-01933-2: as R72 on sheet Sheet7; Case Code (Metric): 3216; Tolerance: 1%; Mount: Surface Mount; Packaging: Tape and Reel; Case Code (Imperial): 1206; Depth: 1.6mm; Military Standard: Not; Max Operating Temperature: 155°C; Length: 3.2mm; Radiation Hardening: No; Number of Terminations: 2; Features: Automotive AEC-Q200; Width: 1.6mm; Lead Free: Lead Free; Composition: Thick Film; Package Quantity: 10; Min Operating Temperature: -55°C; Contact Plating: Tin; Voltage Rating (DC): 200V; Temperature Coefficient: 100ppm/°C; Height: 0.55mm; Weight: 0.000353oz; Case/Package: 1206; Voltage Rating: 200V; Termination: SMD/SMT; Max Power Dissipation: 250mW
U32 = CMP-0475-00260-1: as U30 on sheet Sheet7; ComponentLink2URL: http://cds.linear.com/docs/en/datasheet/3260fa.pdf; PackageReference: MSE-16; Mounting Technology: Surface Mount; DatasheetVersion: Rev. A; ComponentLink3URL: http://cds.linear.com/docs/en/packaging/05081667_F_MSE16.pdf; ComponentLink1Description: Manufacturer URL; ComponentLink1URL: http://www.linear.com/; Packing: Tape and Reel; RoHS: TRUE; PackageDescription: 16-Pin Plastic MSOP, Exposed Die Pad, Body 4.039 x 3 mm, Pitch 0.5 mm; ComponentLink3Description: Package Specification; ComponentLink2Description: Datasheet; PackageVersion: Rev. F, 05/2013

## Sheet Sheet10.SchDoc
size A; SheetNumber: 10; SheetTotal: 10
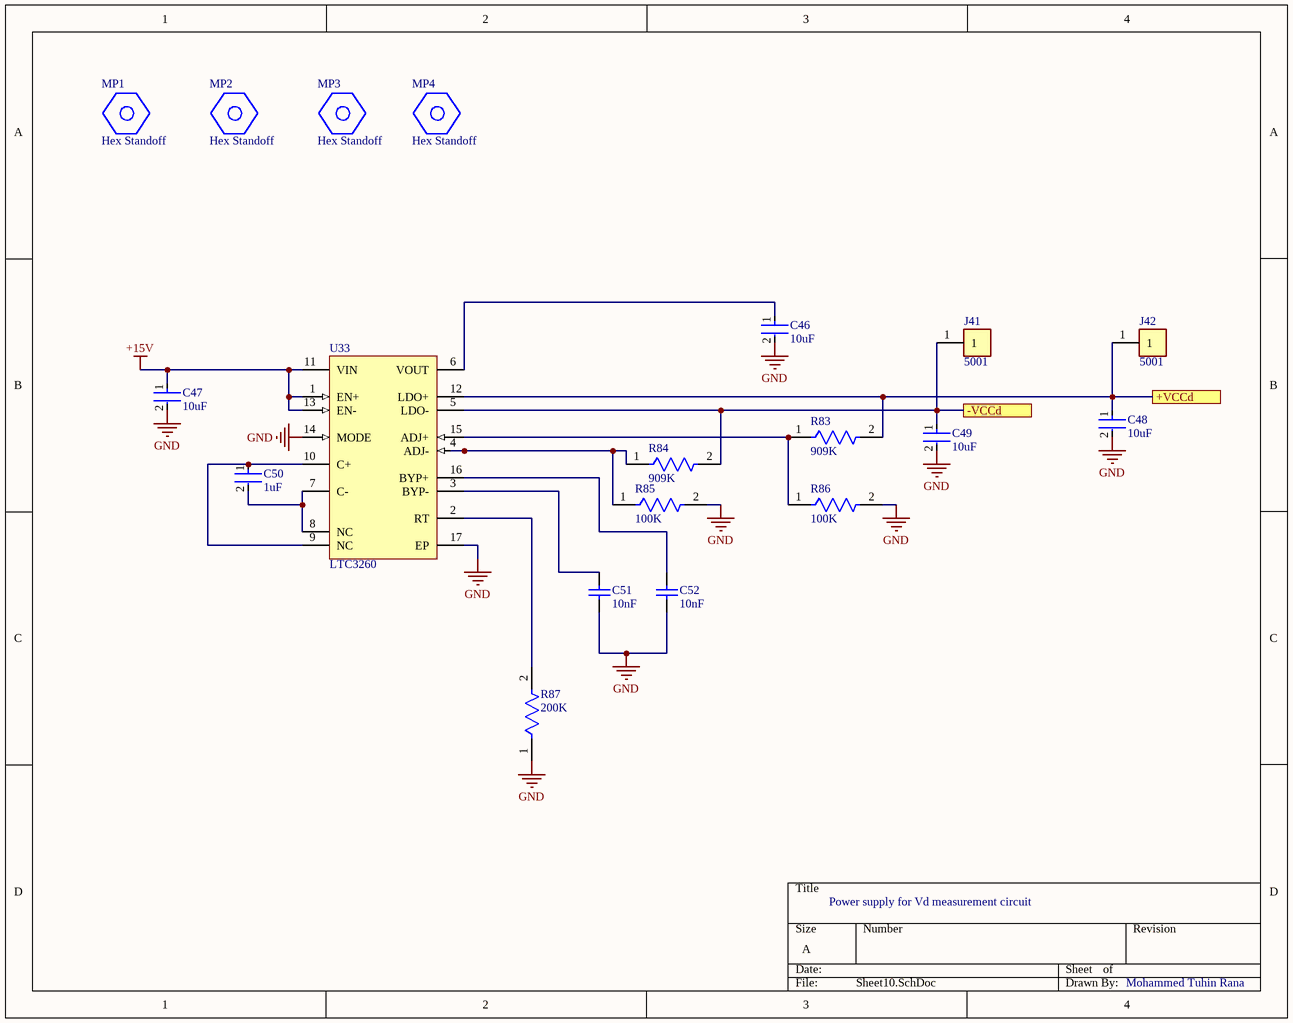
[diagram p9: Sheet10.SchDoc]

### Parts
C46  10uF  [FP-C1210C106M6PACTU-MFG]
C47  10uF  [FP-C1210C106M6PACTU-MFG]
C48  10uF  [FP-C1210C106M6PACTU-MFG]
C49  10uF  [FP-C1210C106M6PACTU-MFG]
C50  1uF  [FP-GRM55D-0_4-IPC_A]
C51  10nF  [CAPC2013X100X50NL20T25]
C52  10nF  [CAPC2013X100X50NL20T25]
J41  5001  [FP-5001-MFG]
J42  5001  [FP-5001-MFG]
MP1  Hex Standoff  [FP-2056-440-AL-MFG]
MP2  Hex Standoff  [FP-2056-440-AL-MFG]
MP3  Hex Standoff  [FP-2056-440-AL-MFG]
MP4  Hex Standoff  [FP-2056-440-AL-MFG]
R83  909K  [FP-CRCW1206-e3-IPC_C]
R84  909K  [FP-CRCW1206-e3-IPC_C]
R85  100K  [FP-AC1206-MFG]
R86  100K  [FP-AC1206-MFG]
R87  200K  [FP-CRCW1206-e3-MFG]
U33  LTC3260  [LT-MSE-16-EDP_L]

### Ports
+VCCd (see Sheet5[1A], Sheet5[1C], Sheet5[2A], Sheet5[2B], Sheet5[3B], Sheet5[3C], Sheet5[4B]), -VCCd (see Sheet5[1B], Sheet5[1D], Sheet5[2B], Sheet5[2C], Sheet5[3C], Sheet5[3D], Sheet5[4C])

### Nets
+15V: C47.1 U33.1(EN+) U33.11(VIN) U33.13(EN-)
GND: C46.2 C47.2 C48.2 C49.2 C51.1 C52.1 R85.2 R86.2 R87.1 U33.14(MODE) U33.17(EP)
NetC46_1: C46.1 U33.6(VOUT)
NetC48_1: C48.1 J42.1 R83.2 U33.12(LDO+) ; port +VCCd
NetC49_1: C49.1 J41.1 R84.2 U33.5(LDO-) ; port -VCCd
NetC50_1: C50.1 U33.9(NC) U33.10(C+)
NetC50_2: C50.2 U33.7(C-) U33.8(NC)
NetC51_2: C51.2 U33.3(BYP-)
NetC52_2: C52.2 U33.16(BYP+)
NetR83_1: R83.1 R86.1 U33.15(ADJ+)
NetR84_1: R84.1 R85.1 U33.4(ADJ-)
NetR87_2: R87.2 U33.2(RT)

### Notes on the sheet
- Power supply for Vd measurement circuit
- Mohammed Tuhin Rana

### Library data of the parts
C46-C49 = CMP-1038-02235-2: as C25 on sheet Sheet7; Voltage: 35V; Package Quantity: 2000; Series: C; Case Code (Metric): 3225; Length: 3.2mm; Dielectric: X5R; Height: 1.9mm; Max Operating Temperature: 85°C; Termination: SMD/SMT; Case/Package: 1210; Min Operating Temperature: -55°C; Depth: 2.5mm; Packaging: Tape and Reel; Case Code (Imperial): 1210; Width: 2.5mm; Radiation Hardening: No; Voltage Rating: 35V; Mount: Surface Mount; Voltage Rating (DC): 35V; Capacitance: 10uF; Thickness: 0.083inch; Construction: Flat; REACH SVHC: No SVHC
C50 = CMP-2000-06370-2: as C29 on sheet Sheet7; Width: 5mm; Capacitance: 1uF; Height: 2mm; Case Code (Imperial): 2220; Voltage Rating (DC): 250V; Max Operating Temperature: 125°C; Number of Pins: 2; Min Operating Temperature: -55°C; Termination: SMD/SMT; Case/Package: 2220; Dielectric: X7R; Material: Ceramic; REACH SVHC: No SVHC; Voltage: 250V; Packaging: Tape and Reel; Thickness: 0.087inch; Depth: 5mm; Package Quantity: 1; Tolerance: 10%; Mount: Surface Mount; Voltage Rating: 250V; Length: 5.7mm; Case Code (Metric): 5750; Lead Free: Lead Free
C51 C52 = CMP-2007-03708-1: as C30 on sheet Sheet7
J41 J42 = CMP-2000-05181-2: as J29 on sheet Sheet5; Insulation Material: Nylon; Mount: Through Hole; RoHS Compliant: Yes; Series: THM; Height: 0.3inch; Termination: Through Hole; Material: Nylon; Packaging: Bulk; Contact Material: Bronze; REACH SVHC: No SVHC; Contact Plating: Silver; Orientation: Straight; Lead Free: Lead Free; Package Quantity: 100; Length: 7.62mm; Flammability Rating: UL94 V-0; Number of Contacts: 1; Diameter: 2.54mm; Housing Color: Black; Color: Black
MP1-MP4 = CMP-46196-000003-1: HEX STANDOFF #4-40 ALUM 7/16"; Threaded/Unthreaded: Threaded; Body Length: 0.437inch; Gender: Female, Female; Thread Size: #4-40; Size: 0.187inch; Case/Package: Aluminum; Series: -; Material: Aluminium
R83 R84 = CMP-2003-02425-2: as R68 on sheet Sheet7; Contact Plating: Tin; Number of Terminations: 2; Package Quantity: 10; Case Code (Imperial): 1206; Features: Automotive AEC-Q200; Termination: SMD/SMT; Lead Free: Lead Free; Depth: 1.6mm; Min Operating Temperature: -55°C; Case/Package: 1206; Width: 1.6mm; Tolerance: 1%; Military Standard: Not; Voltage Rating (DC): 200V; Composition: Thick Film; Radiation Hardening: No; Max Power Dissipation: 250mW; Packaging: Tape and Reel; Case Code (Metric): 3216; Height: 0.024inch; Temperature Coefficient: 100ppm/°C; Max Operating Temperature: 155°C; Length: 3.2mm; Weight: 0.000353oz
R85 R86 = CMP-2003-04909-2: as R70 on sheet Sheet7; Mouser Description: RES SMD 100K OHM 1% 1/4W 1206; Ipc Land Pattern Name: RESC310160X55; Temperature Range Low: -55°C; Package: AC1206; Temperature: -55°C to +155°C; Device Class L3: Chip SMD Resistors; Lead Free: Yes; Temperature Range High: +155°C; Series: AC; Octopart: https://octopart.com/ac1206fr-07100kl-yageo-21711116; Height: 0.65mm; Footprint Url: http://www.yageo.com/exep/pages/download/literatures/PYu-R_Mount_10.pdf; RoHS: TRUE; Category: Res; Automotive: Yes; Composition: Thick Film; Device Class L2: Resistors; ComponentLink2URL: http://www.yageo.com/NewPortal/yageodocoutput?fileName=/pdf/R-Chip/PYu-AC_51_RoHS_L_6.pdf; Digikey Description: RES SMD 100K OHM 1% 1/4W 1206; ComponentLink2Description: Datasheet; Device Class L1: Passive Components
R87 = CMP-2003-01933-2: as R72 on sheet Sheet7; Case Code (Metric): 3216; Tolerance: 1%; Mount: Surface Mount; Packaging: Tape and Reel; Case Code (Imperial): 1206; Depth: 1.6mm; Military Standard: Not; Max Operating Temperature: 155°C; Length: 3.2mm; Radiation Hardening: No; Number of Terminations: 2; Features: Automotive AEC-Q200; Width: 1.6mm; Lead Free: Lead Free; Composition: Thick Film; Package Quantity: 10; Min Operating Temperature: -55°C; Contact Plating: Tin; Voltage Rating (DC): 200V; Temperature Coefficient: 100ppm/°C; Height: 0.55mm; Weight: 0.000353oz; Case/Package: 1206; Voltage Rating: 200V; Termination: SMD/SMT; Max Power Dissipation: 250mW
U33 = CMP-0475-00260-1: as U30 on sheet Sheet7; ComponentLink2URL: http://cds.linear.com/docs/en/datasheet/3260fa.pdf; PackageReference: MSE-16; Mounting Technology: Surface Mount; DatasheetVersion: Rev. A; ComponentLink3URL: http://cds.linear.com/docs/en/packaging/05081667_F_MSE16.pdf; ComponentLink1Description: Manufacturer URL; ComponentLink1URL: http://www.linear.com/; Packing: Tape and Reel; RoHS: TRUE; PackageDescription: 16-Pin Plastic MSOP, Exposed Die Pad, Body 4.039 x 3 mm, Pitch 0.5 mm; ComponentLink3Description: Package Specification; ComponentLink2Description: Datasheet; PackageVersion: Rev. F, 05/2013

## Nets that join several sheets
+15V: Sheet1 (8 pins), Sheet7 (C26.1 U30.1 U30.11 U30.13), Sheet8 (C33.1 U31.1 U31.11 U31.13), Sheet9 (C40.1 U32.1 U32.11 U32.13), Sheet10 (C47.1 U33.1 U33.11 U33.13)
GND: Sheet1 (11 pins), Sheet2 (18 pins), Sheet3 (8 pins), Sheet4 (8 pins), Sheet6 (8 pins), Sheet5 (8 pins), Sheet7 (11 pins), Sheet8 (11 pins), Sheet9 (11 pins), Sheet10 (11 pins)
NetC3_1: Sheet1 (5 pins), Sheet2 (9 pins)
NetC27_1: Sheet3 (7 pins), Sheet7 (C27.1 J35.1 R68.2 U30.12)
NetC28_1: Sheet3 (7 pins), Sheet7 (C28.1 J36.1 R69.2 U30.5)
NetC34_1: Sheet4 (7 pins), Sheet8 (C34.1 J37.1 R73.2 U31.12)
NetC35_1: Sheet4 (7 pins), Sheet8 (C35.1 J38.1 R74.2 U31.5)
NetC41_1: Sheet6 (7 pins), Sheet9 (C41.1 J39.1 R78.2 U32.12)
NetC42_1: Sheet6 (7 pins), Sheet9 (C42.1 J40.1 R79.2 U32.5)
NetC48_1: Sheet5 (7 pins), Sheet10 (C48.1 J42.1 R83.2 U33.12)
NetC49_1: Sheet5 (7 pins), Sheet10 (C49.1 J41.1 R84.2 U33.5)
NetQ1_3: Sheet2 (Q1.3 R8.1 R17.1), Sheet3 (U3.3)
NetQ2_3: Sheet2 (Q2.3 R10.1 R18.1), Sheet4 (U10.3)
NetQ3_3: Sheet2 (Q3.3 Q4.3 R12.1 R16.1), Sheet6 (U17.3)
NetQ5_3: Sheet2 (Q5.3 R15.1), Sheet5 (U24.3)